# Altium schematic sheet LCD_Section.SchDoc
size A4
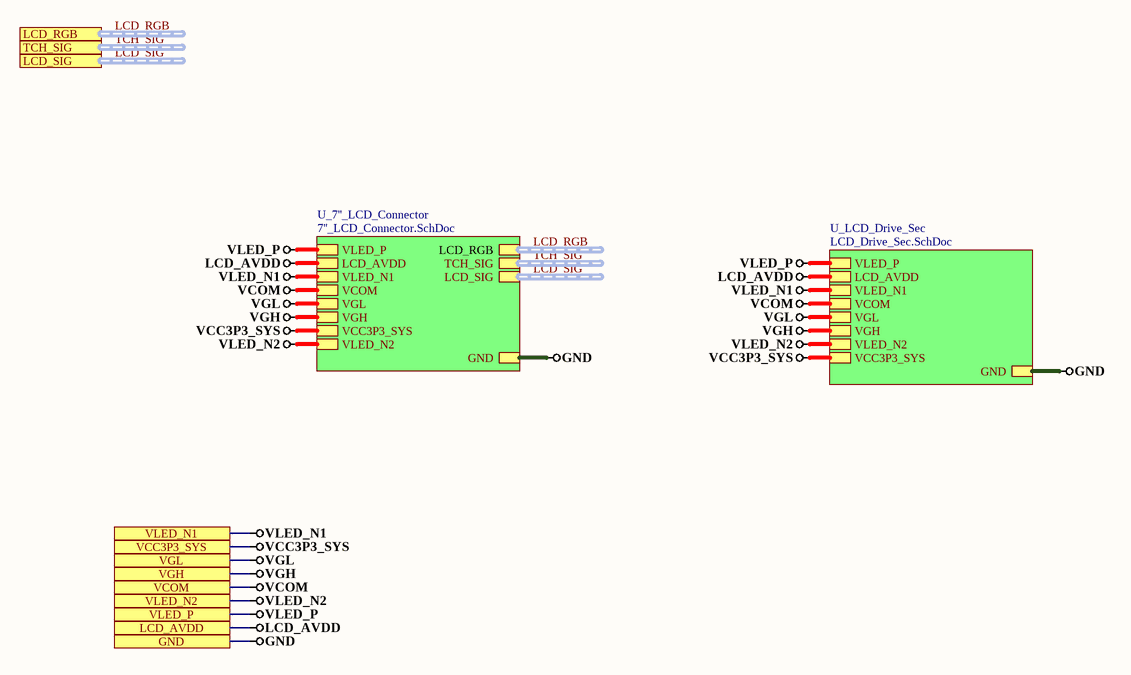
[diagram p0: LCD_Section.SchDoc]

## Sub-sheets
U_7''_LCD_Connector = 7''_LCD_Connector.SchDoc: LCD_RGB (harness LCD_RGB), GND, VLED_P, LCD_AVDD, TCH_SIG (harness TCH_SIG), LCD_SIG (harness LCD_SIG), VLED_N1, VCOM, VGL, VGH, VCC3P3_SYS, VLED_N2
U_LCD_Drive_Sec = LCD_Drive_Sec.SchDoc: GND, VLED_P, LCD_AVDD, VLED_N1, VCOM, VGL, VGH, VLED_N2, VCC3P3_SYS

## Ports
GND, LCD_AVDD, LCD_RGB (harness LCD_RGB), LCD_SIG (harness LCD_SIG), TCH_SIG (harness TCH_SIG), VCC3P3_SYS, VCOM, VGH, VGL, VLED_N1, VLED_N2, VLED_P

## Nets
GND: port GND, sheet U_7''_LCD_Connector/GND, sheet U_LCD_Drive_Sec/GND
LCD_AVDD: port LCD_AVDD, sheet U_7''_LCD_Connector/LCD_AVDD, sheet U_LCD_Drive_Sec/LCD_AVDD
VCC3P3_SYS: port VCC3P3_SYS, sheet U_7''_LCD_Connector/VCC3P3_SYS, sheet U_LCD_Drive_Sec/VCC3P3_SYS
VCOM: port VCOM, sheet U_7''_LCD_Connector/VCOM, sheet U_LCD_Drive_Sec/VCOM
VGH: port VGH, sheet U_7''_LCD_Connector/VGH, sheet U_LCD_Drive_Sec/VGH
VGL: port VGL, sheet U_7''_LCD_Connector/VGL, sheet U_LCD_Drive_Sec/VGL
VLED_N1: port VLED_N1, sheet U_7''_LCD_Connector/VLED_N1, sheet U_LCD_Drive_Sec/VLED_N1
VLED_N2: port VLED_N2, sheet U_7''_LCD_Connector/VLED_N2, sheet U_LCD_Drive_Sec/VLED_N2
VLED_P: port VLED_P, sheet U_7''_LCD_Connector/VLED_P, sheet U_LCD_Drive_Sec/VLED_P

## Buses and harness runs
harness LCD_RGB = port LCD_RGB
harness LCD_RGB = sheet U_7''_LCD_Connector/LCD_RGB
harness LCD_SIG = port LCD_SIG
harness LCD_SIG = sheet U_7''_LCD_Connector/LCD_SIG
harness TCH_SIG = port TCH_SIG
harness TCH_SIG = sheet U_7''_LCD_Connector/TCH_SIG